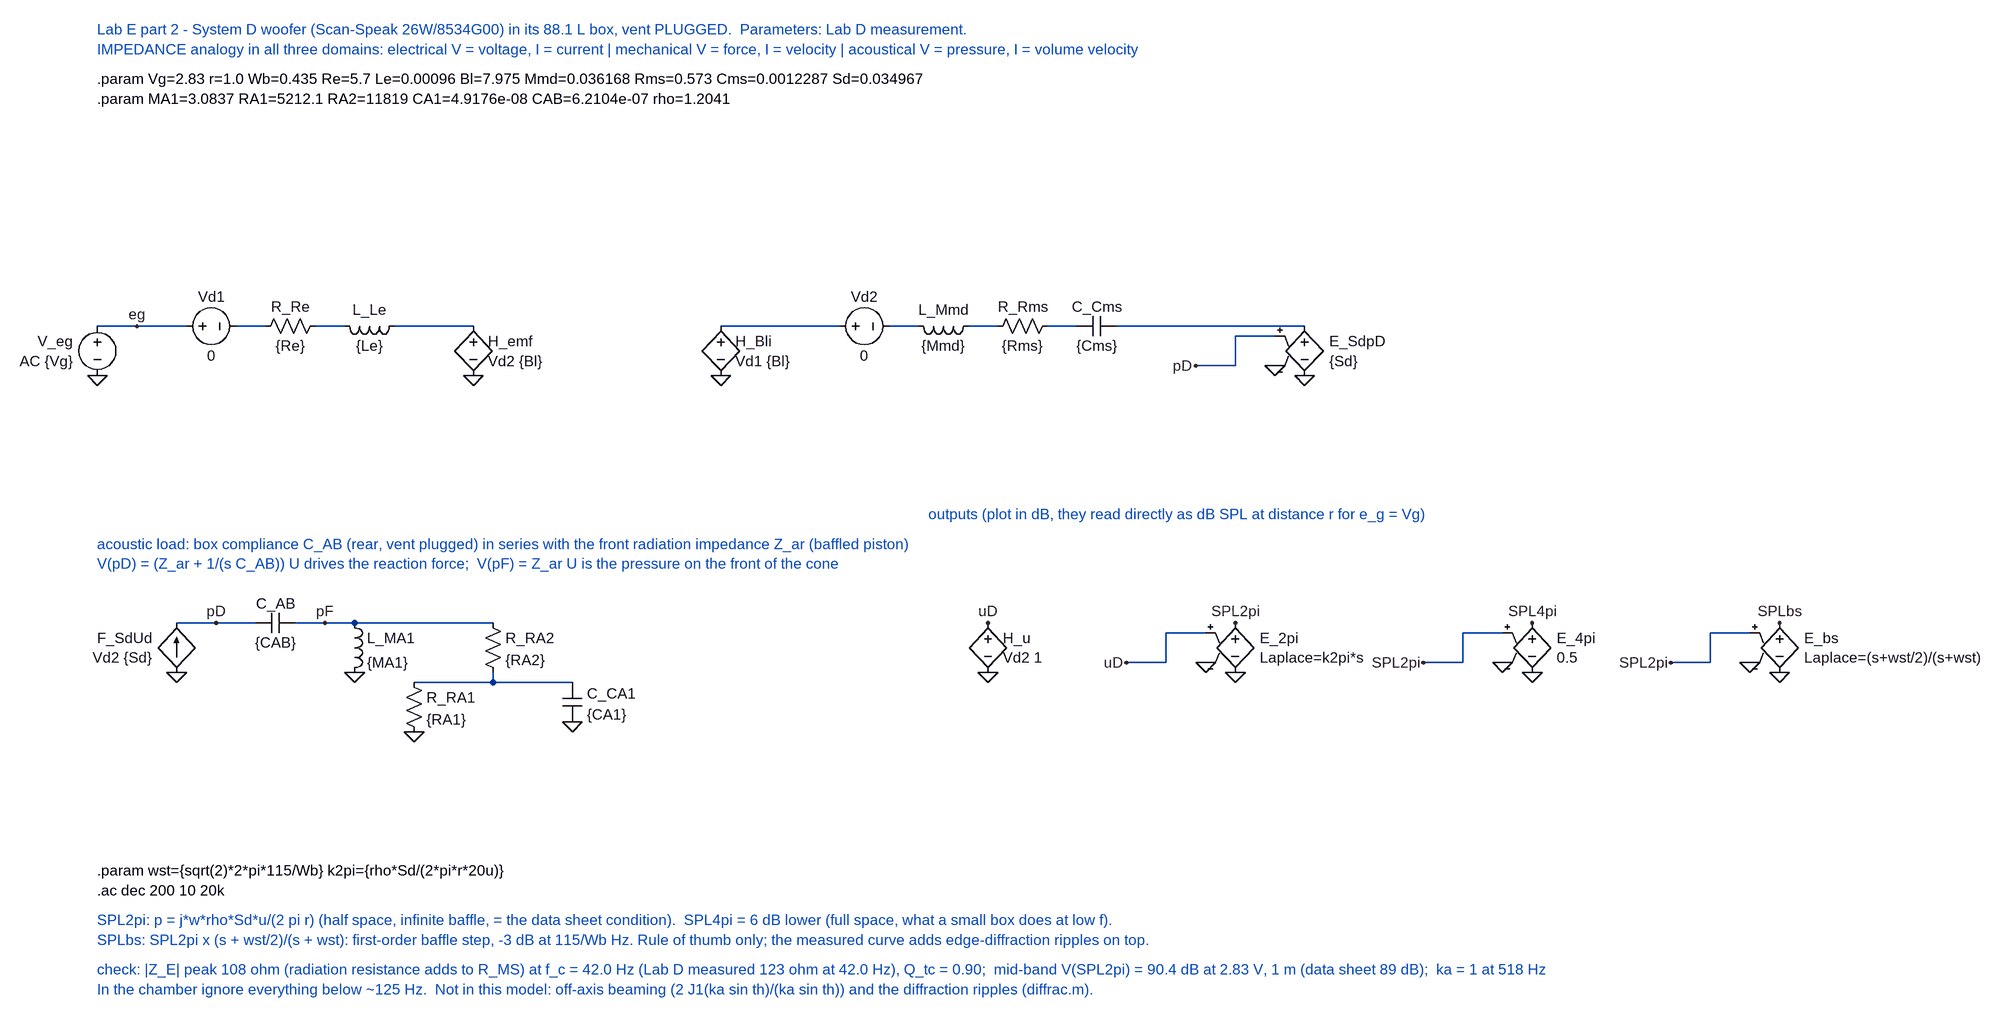
[diagram p0: schematic LabE_Woofer_LabD.asc]
LabE_Woofer_LabD.asc, the LTspice schematic file:
Version 4
SHEET 1 3000 1600
WIRE 0 0 144 0
WIRE 224 0 272 0
WIRE 352 0 400 0
WIRE 480 0 608 0
WIRE 1008 0 1200 0
WIRE 1280 0 1328 0
WIRE 1408 0 1456 0
WIRE 1536 0 1584 0
WIRE 1648 0 1952 0
WIRE 1904 16 1840 16
WIRE 1840 16 1840 64
WIRE 1840 64 1776 64
WIRE 128 480 256 480
WIRE 320 480 416 480
WIRE 416 480 640 480
WIRE 640 560 640 576
WIRE 512 576 768 576
WIRE 1792 496 1728 496
WIRE 1728 496 1728 544
WIRE 1728 544 1664 544
WIRE 2272 496 2208 496
WIRE 2208 496 2208 544
WIRE 2208 544 2144 544
WIRE 2672 496 2608 496
WIRE 2608 496 2608 544
WIRE 2608 544 2544 544
FLAG 0 80 0
FLAG 64 0 eg
FLAG 608 80 0
FLAG 1008 80 0
FLAG 1952 80 0
FLAG 1904 64 0
FLAG 1776 64 pD
FLAG 128 560 0
FLAG 192 480 pD
FLAG 368 480 pF
FLAG 416 560 0
FLAG 512 656 0
FLAG 768 640 0
FLAG 1440 560 0
FLAG 1440 480 uD
FLAG 1840 560 0
FLAG 1792 544 0
FLAG 1664 544 uD
FLAG 1840 480 SPL2pi
FLAG 2320 560 0
FLAG 2272 544 0
FLAG 2144 544 SPL2pi
FLAG 2320 480 SPL4pi
FLAG 2720 560 0
FLAG 2672 544 0
FLAG 2544 544 SPL2pi
FLAG 2720 480 SPLbs
SYMBOL voltage 0 -16 R0
WINDOW 0 -40 40 Right 2
WINDOW 3 -40 72 Right 2
SYMATTR InstName V_eg
SYMATTR Value AC {Vg}
SYMBOL voltage 128 0 R270
WINDOW 0 32 56 VTop 2
WINDOW 3 -32 56 VBottom 2
SYMATTR InstName Vd1
SYMATTR Value 0
SYMBOL res 368 -16 R90
WINDOW 0 0 56 VBottom 2
WINDOW 3 32 56 VTop 2
SYMATTR InstName R_Re
SYMATTR Value {Re}
SYMBOL ind 496 -16 R90
WINDOW 0 5 56 VBottom 2
WINDOW 3 32 56 VTop 2
SYMATTR InstName L_Le
SYMATTR Value {Le}
SYMATTR SpiceLine Rser=0
SYMBOL h 608 -16 R0
WINDOW 0 24 40 Left 2
WINDOW 3 24 72 Left 2
SYMATTR InstName H_emf
SYMATTR Value Vd2 {Bl}
SYMBOL h 1008 -16 R0
WINDOW 0 24 40 Left 2
WINDOW 3 24 72 Left 2
SYMATTR InstName H_Bli
SYMATTR Value Vd1 {Bl}
SYMBOL voltage 1184 0 R270
WINDOW 0 32 56 VTop 2
WINDOW 3 -32 56 VBottom 2
SYMATTR InstName Vd2
SYMATTR Value 0
SYMBOL ind 1424 -16 R90
WINDOW 0 5 56 VBottom 2
WINDOW 3 32 56 VTop 2
SYMATTR InstName L_Mmd
SYMATTR Value {Mmd}
SYMATTR SpiceLine Rser=0
SYMBOL res 1552 -16 R90
WINDOW 0 0 56 VBottom 2
WINDOW 3 32 56 VTop 2
SYMATTR InstName R_Rms
SYMATTR Value {Rms}
SYMBOL cap 1648 -16 R90
WINDOW 0 0 32 VBottom 2
WINDOW 3 32 32 VTop 2
SYMATTR InstName C_Cms
SYMATTR Value {Cms}
SYMBOL e 1952 -16 R0
WINDOW 0 40 40 Left 2
WINDOW 3 40 72 Left 2
SYMATTR InstName E_SdpD
SYMATTR Value {Sd}
SYMBOL f 128 560 R180
WINDOW 0 40 56 Left 2
WINDOW 3 40 24 Left 2
SYMATTR InstName F_SdUd
SYMATTR Value Vd2 {Sd}
SYMBOL cap 320 464 R90
WINDOW 0 0 32 VBottom 2
WINDOW 3 32 32 VTop 2
SYMATTR InstName C_AB
SYMATTR Value {CAB}
SYMBOL ind 400 464 R0
SYMATTR InstName L_MA1
SYMATTR Value {MA1}
SYMATTR SpiceLine Rser=0
SYMBOL res 624 464 R0
SYMATTR InstName R_RA2
SYMATTR Value {RA2}
SYMBOL res 496 560 R0
SYMATTR InstName R_RA1
SYMATTR Value {RA1}
SYMBOL cap 752 576 R0
WINDOW 0 40 18 Left 2
WINDOW 3 40 52 Left 2
SYMATTR InstName C_CA1
SYMATTR Value {CA1}
SYMBOL h 1440 464 R0
WINDOW 0 24 40 Left 2
WINDOW 3 24 72 Left 2
SYMATTR InstName H_u
SYMATTR Value Vd2 1
SYMBOL e 1840 464 R0
WINDOW 0 40 40 Left 2
WINDOW 3 40 72 Left 2
SYMATTR InstName E_2pi
SYMATTR Value Laplace=k2pi*s
SYMBOL e 2320 464 R0
WINDOW 0 40 40 Left 2
WINDOW 3 40 72 Left 2
SYMATTR InstName E_4pi
SYMATTR Value 0.5
SYMBOL e 2720 464 R0
WINDOW 0 40 40 Left 2
WINDOW 3 40 72 Left 2
SYMATTR InstName E_bs
SYMATTR Value Laplace=(s+wst/2)/(s+wst)
TEXT 0 -480 Left 2 ;Lab E part 2 - System D woofer (Scan-Speak 26W/8534G00) in its 88.1 L box, vent PLUGGED.  Parameters: Lab D measurement.
TEXT 0 -448 Left 2 ;IMPEDANCE analogy in all three domains: electrical V = voltage, I = current | mechanical V = force, I = velocity | acoustical V = pressure, I = volume velocity
TEXT 0 -400 Left 2 !.param Vg=2.83 r=1.0 Wb=0.435 Re=5.7 Le=0.00096 Bl=7.975 Mmd=0.036168 Rms=0.573 Cms=0.0012287 Sd=0.034967
TEXT 0 -368 Left 2 !.param MA1=3.0837 RA1=5212.1 RA2=11819 CA1=4.9176e-08 CAB=6.2104e-07 rho=1.2041
TEXT 0 352 Left 2 ;acoustic load: box compliance C_AB (rear, vent plugged) in series with the front radiation impedance Z_ar (baffled piston)
TEXT 0 384 Left 2 ;V(pD) = (Z_ar + 1/(s C_AB)) U drives the reaction force;  V(pF) = Z_ar U is the pressure on the front of the cone
TEXT 1344 304 Left 2 ;outputs (plot in dB, they read directly as dB SPL at distance r for e_g = Vg)
TEXT 0 880 Left 2 !.param wst={sqrt(2)*2*pi*115/Wb} k2pi={rho*Sd/(2*pi*r*20u)}
TEXT 0 912 Left 2 !.ac dec 200 10 20k
TEXT 0 960 Left 2 ;SPL2pi: p = j*w*rho*Sd*u/(2 pi r) (half space, infinite baffle, = the data sheet condition).  SPL4pi = 6 dB lower (full space, what a small box does at low f).
TEXT 0 992 Left 2 ;SPLbs: SPL2pi x (s + wst/2)/(s + wst): first-order baffle step, -3 dB at 115/Wb Hz. Rule of thumb only; the measured curve adds edge-diffraction ripples on top.
TEXT 0 1040 Left 2 ;check: |Z_E| peak 108 ohm (radiation resistance adds to R_MS) at f_c = 42.0 Hz (Lab D measured 123 ohm at 42.0 Hz), Q_tc = 0.90;  mid-band V(SPL2pi) = 90.4 dB at 2.83 V, 1 m (data sheet 89 dB);  ka = 1 at 518 Hz
TEXT 0 1072 Left 2 ;In the chamber ignore everything below ~125 Hz.  Not in this model: off-axis beaming (2 J1(ka sin th)/(ka sin th)) and the diffraction ripples (diffrac.m).

The netlist it stands for:
* LabE_Woofer_LabD.asc
V_eg eg 0 AC {Vg}
Vd1 eg N001 0
R_Re N002 N001 {Re}
L_Le N003 N002 {Le} Rser=0
H_emf N003 0 Vd2 {Bl}
H_Bli N004 0 Vd1 {Bl}
Vd2 N004 N005 0
L_Mmd N006 N005 {Mmd} Rser=0
R_Rms N007 N006 {Rms}
C_Cms N008 N007 {Cms}
E_SdpD N008 0 pD 0 {Sd}
F_SdUd 0 pD Vd2 {Sd}
C_AB pF pD {CAB}
L_MA1 pF 0 {MA1} Rser=0
R_RA2 pF N009 {RA2}
R_RA1 N009 0 {RA1}
C_CA1 N009 0 {CA1}
H_u uD 0 Vd2 1
E_2pi SPL2pi 0 uD 0 Laplace=k2pi*s
E_4pi SPL4pi 0 SPL2pi 0 0.5
E_bs SPLbs 0 SPL2pi 0 Laplace=(s+wst/2)/(s+wst)
* Lab E part 2 - System D woofer (Scan-Speak 26W/8534G00) in its 88.1 L box, vent PLUGGED.  Parameters: Lab D measurement.
* IMPEDANCE analogy in all three domains: electrical V = voltage, I = current | mechanical V = force, I = velocity | acoustical V = pressure, I = volume velocity
.param Vg=2.83 r=1.0 Wb=0.435 Re=5.7 Le=0.00096 Bl=7.975 Mmd=0.036168 Rms=0.573 Cms=0.0012287 Sd=0.034967
.param MA1=3.0837 RA1=5212.1 RA2=11819 CA1=4.9176e-08 CAB=6.2104e-07 rho=1.2041
* acoustic load: box compliance C_AB (rear, vent plugged) in series with the front radiation impedance Z_ar (baffled piston)
* V(pD) = (Z_ar + 1/(s C_AB)) U drives the reaction force;  V(pF) = Z_ar U is the pressure on the front of the cone
* outputs (plot in dB, they read directly as dB SPL at distance r for e_g = Vg)
.param wst={sqrt(2)*2*pi*115/Wb} k2pi={rho*Sd/(2*pi*r*20u)}
.ac dec 200 10 20k
* SPL2pi: p = j*w*rho*Sd*u/(2 pi r) (half space, infinite baffle, = the data sheet condition).  SPL4pi = 6 dB lower (full space, what a small box does at low f).
* SPLbs: SPL2pi x (s + wst/2)/(s + wst): first-order baffle step, -3 dB at 115/Wb Hz. Rule of thumb only; the measured curve adds edge-diffraction ripples on top.
* check: |Z_E| peak 108 ohm (radiation resistance adds to R_MS) at f_c = 42.0 Hz (Lab D measured 123 ohm at 42.0 Hz), Q_tc = 0.90;  mid-band V(SPL2pi) = 90.4 dB at 2.83 V, 1 m (data sheet 89 dB);  ka = 1 at 518 Hz
* In the chamber ignore everything below ~125 Hz.  Not in this model: off-axis beaming (2 J1(ka sin th)/(ka sin th)) and the diffraction ripples (diffrac.m).
.backanno
.end